# Altium schematic sheet MISKO.SchDoc
size A4
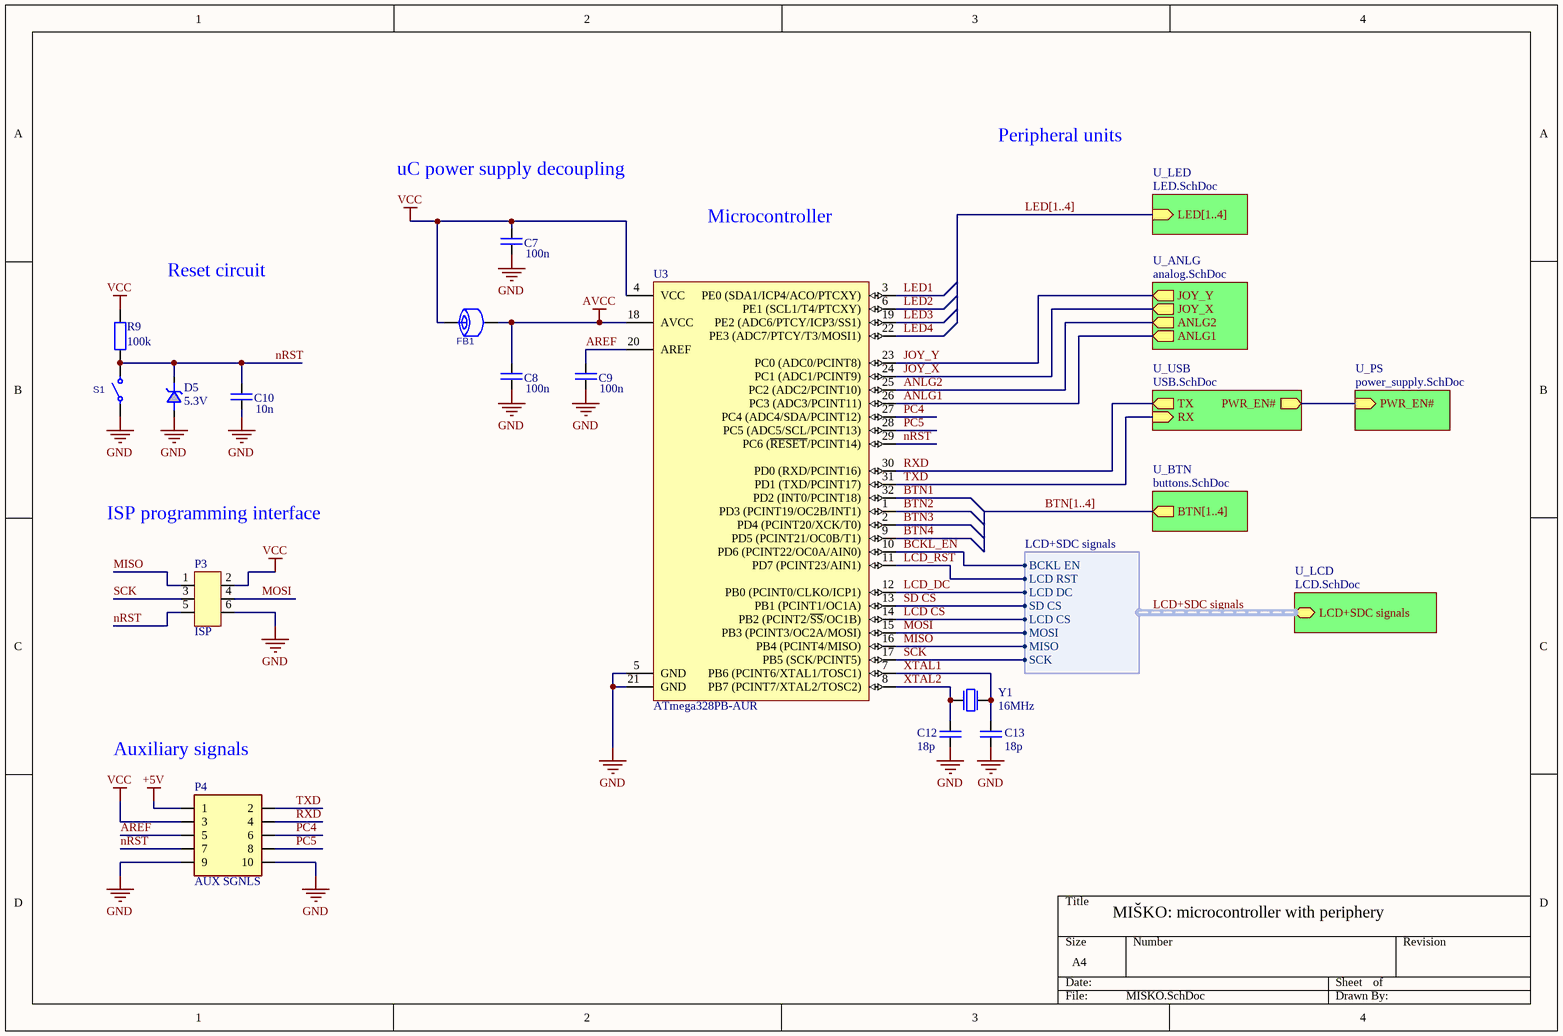
[diagram p0: MISKO.SchDoc]

## Parts
C7  value 100n  [C_0805]  (hidden comment: comment)
C8  value 100n  [C_0805]  (hidden comment: comment)
C9  value 100n  [C_0805]  (hidden comment: comment)
C10  value 10n  [C_0805]  (hidden comment: comment)
C12  value 18p  [C_0805]  (hidden comment: comment)
C13  value 18p  [C_0805]  (hidden comment: comment)
D5  5.3V  [SOD-523]
FB1  value  [SMD_0805]  (value not drawn)
P3  ISP  [HEADER 2X3 SHROUDED]
P4  AUX SGNLS  [HEADER SMD 2X5 100 MILS]
R9  value 100k  [R_0805]  (hidden comment: comment)
S1  (no value)  [PUSH BUTTON 6x6 mm]
U3  ATmega328PB-AUR  [32A_N]
Y1  16MHz  [TXC 7a QUARTZ CRYSTAL]

## Sub-sheets
U_ANLG = analog.SchDoc: JOY_Y (out), JOY_X (out), ANLG2 (out), ANLG1 (out)
U_BTN = buttons.SchDoc: BTN[1..4] (out)
U_LCD = LCD.SchDoc: LCD+SDC signals (bidir, harness LCD+SDC signals)
U_LED = LED.SchDoc: LED[1..4] (in)
U_PS = power_supply.SchDoc: PWR_EN# (in)
U_USB = USB.SchDoc: TX (out), RX (in), PWR_EN# (out)

## Harnesses
LCD+SDC signals: BCKL EN, LCD RST, LCD DC, SD CS, LCD CS, MOSI, MISO, SCK

## Nets
+5V: P4.1
AVCC: C8.1 FB1.2 U3.18(AVCC)
GND: C7.2 C8.2 C9.2 C10.2 C12.2 C13.2 D5.A P3.6 P4.9 P4.10 S1.1 U3.5(GND) U3.21(GND)
VCC: C7.1 FB1.1 P3.2 P4.3 R9.1 U3.4(VCC)
ANLG1: U3.26(PC3_(ADC3/PCINT11)) ; sheet U_ANLG/ANLG1
ANLG2: U3.25(PC2_(ADC2/PCINT10)) ; sheet U_ANLG/ANLG2
AREF: C9.1 P4.5 U3.20(AREF)
BCKL_EN: U3.10(PD6_(PCINT22/OC0A/AIN0)) ; sheet U_LCD/LCD+SDC signals.BCKL EN
BTN1: U3.32(PD2_(INT0/PCINT18))
BTN2: U3.1(PD3_(PCINT19/OC2B/INT1))
BTN3: U3.2(PD4_(PCINT20/XCK/T0))
BTN4: U3.9(PD5_(PCINT21/OC0B/T1))
JOY_X: U3.24(PC1_(ADC1/PCINT9)) ; sheet U_ANLG/JOY_X
JOY_Y: U3.23(PC0_(ADC0/PCINT8)) ; sheet U_ANLG/JOY_Y
LCD CS: U3.14(PB2_(PCINT2/~{SS}/OC1B)) ; sheet U_LCD/LCD+SDC signals.LCD CS
LCD_DC: U3.12(PB0_(PCINT0/CLKO/ICP1)) ; sheet U_LCD/LCD+SDC signals.LCD DC  [project net LCD+SDC signals.LCD DC]
LCD_RST: U3.11(PD7_(PCINT23/AIN1)) ; sheet U_LCD/LCD+SDC signals.LCD RST  [project net LCD+SDC signals.LCD RST]
LED1: U3.3(PE0_(SDA1/ICP4/ACO/PTCXY))
LED2: U3.6(PE1_(SCL1/T4/PTCXY))
LED3: U3.19(PE2_(ADC6/PTCY/ICP3/SS1))
LED4: U3.22(PE3_(ADC7/PTCY/T3/MOSI1))
MISO: P3.1 U3.16(PB4_(PCINT4/MISO)) ; sheet U_LCD/LCD+SDC signals.MISO  [project net LCD+SDC signals.MISO]
MOSI: P3.4 U3.15(PB3_(PCINT3/OC2A/MOSI)) ; sheet U_LCD/LCD+SDC signals.MOSI  [project net LCD+SDC signals.MOSI]
nRST: C10.1 D5.C P3.5 P4.7 R9.2 S1.2 U3.29(PC6_(~{RESET}/PCINT14))
PC4: P4.6 U3.27(PC4_(ADC4/SDA/PCINT12))
PC5: P4.8 U3.28(PC5_(ADC5/SCL/PCINT13))
RXD: P4.4 U3.30(PD0_(RXD/PCINT16)) ; sheet U_USB/TX
SCK: P3.3 U3.17(PB5_(SCK/PCINT5)) ; sheet U_LCD/LCD+SDC signals.SCK  [project net LCD+SDC signals.SCK]
SD CS: U3.13(PB1_(PCINT1/OC1A)) ; sheet U_LCD/LCD+SDC signals.SD CS  [project net LCD+SDC signals.SD CS]
TXD: P4.2 U3.31(PD1_(TXD/PCINT17)) ; sheet U_USB/RX
XTAL1: C13.1 U3.7(PB6_(PCINT6/XTAL1/TOSC1)) Y1.2
XTAL2: C12.1 U3.8(PB7_(PCINT7/XTAL2/TOSC2)) Y1.1
(unnamed): sheet U_USB/PWR_EN#, sheet U_PS/PWR_EN#

## Buses and harness runs
bus BTN[1..4] = sheet U_BTN/BTN[1..4]
bus LED[1..4] = sheet U_LED/LED[1..4]
harness LCD+SDC signals = sheet U_LCD/LCD+SDC signals

## Notes on the sheet
- uC power supply decoupling
- Peripheral units
- Microcontroller
- Reset circuit
- ISP programming interface
- (near P4) Auxiliary signals
- MIŠKO: microcontroller with periphery

## Library data of the parts
C7-C10 C12 C13 = Capacitor: Generic capacitor
D5 = ESD7371XV2T1G: ESD Protection Device, 20 V, SOD-523, 2 Pins, 5.3 V, 300 mW, ESD7371 Series; HelpURL: https://www.farnell.com/datasheets/2907082.pdf; Manufacturer part number: ESD7371XV2T1G
FB1 = Ferrite bead: Generic ferrite bead; Value: value
P3 = Pin header 2x3 shrouded: Generic shrouded pin header, 2x3, male
P4 = M20-8760542P: Pin Header, Vertical, Wire-to-Board, 2.54 mm, 2 Rows, 10 Contacts, Surface Mount Straight, M20-87; Manufacturer_Name: Harwin; Datasheet Link: https://cdn.harwin.com/pdfs/M20-876P.pdf; Manufacturer_Part_Number: M20-8760542P; Mouser Part Number: 855-M20-8760542P; Mouser Price/Stock: https://www.mouser.co.uk/ProductDetail/Harwin/M20-8760542P?qs=vF78I%252BjhbY%252B9gKdT9lbnBA%3D%3D
R9 = Resistor: Generic resistor
S1 = Push button: Generic push button; Value: *
U3 = ATmega328PB-AUR: 8-bit AVR Microcontroller, 32KB Flash, 1KB EEPROM, 2KB SRAM, 32-pin TQFP, Industrial Grade (-40°C to 85°C), Reel; HelpURL: http://ww1.microchip.com/downloads/en/DeviceDoc/40001907A.pdf; Manufacturer part number: ATmega328PB-AUR
Y1 = 7A-16.000MAAJ-T: Crystal, 16 MHz, SMD, 5mm x 3.2mm, 30 ppm, 18 pF, 30 ppm, 7A Series; Manufacturer: TCX; Dealer number: 1841946; Dealer: Farnell; Load capacitance: 18pF; Frequency tolerance: 30ppm; Category: Crystals; Price: 0.91; Manufacturer Number: 7A-16.000MAAJ-T; Value: 16MHz; Technology: SMT; Case: 5X3.2; HelpURL: https://www.farnell.com/datasheets/1041607.pdf